# Altium schematic sheet Connector_Sheet.SchDoc
size A4; DocumentNumber: 5; SheetNumber: 6; SheetTotal: 6
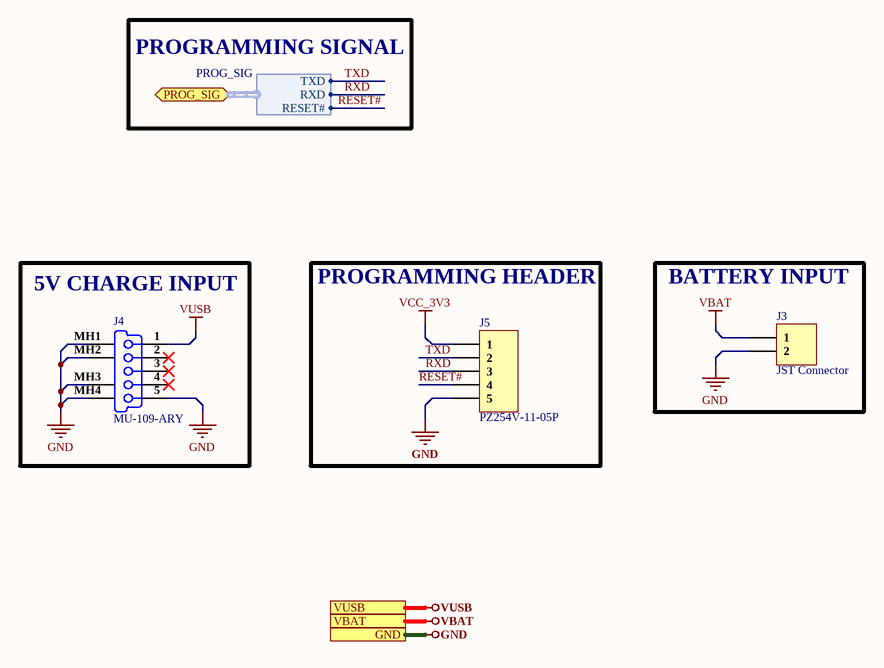
[diagram p0: Connector_Sheet.SchDoc]

## Parts
J3  JST Connector  [JST Connector]
J4  MU-109-ARY  [MU-109-ARY]
J5  PZ254V-11-05P  [PZ254V-11-05P]

## Blocks framed on the sheet
5V CHARGE INPUT: J4
PROGRAMMING HEADER: J5
BATTERY INPUT: J3

## Ports
GND, PROG_SIG (bidir, harness PROG_SIG), VBAT, VUSB

## Harnesses
PROG_SIG: TXD, RXD, RESET#

## Nets
GND: J3.2 J4.5(GND) J4.MH1(Tab) J4.MH2(Tab) J4.MH3(Tab) J4.MH4(Tab) J5.5 ; port GND
VBAT: J3.1 ; port VBAT
VCC_3V3: J5.1
VUSB: J4.1(V_BUS_(5V)) ; port VUSB
RESET#: J5.4 ; port PROG_SIG.RESET#
RXD: J5.3 ; port PROG_SIG.RXD
TXD: J5.2 ; port PROG_SIG.TXD

Not connected (* = marked no-connect by the designer): J4 2(D-)* 3(D+)* 4(ID)*

## Notes on the sheet
- PROGRAMMING SIGNAL
- 1
- Huzaifa Ali

## Library data of the parts
J3 = 2 Pin JST Connector
J4 = MU-109-ARY: 1.5A USB 2.0 1 Sink board 5 Female -20℃~+70℃ Micro-B SMD USB Connectors ROHS; Manufacturer: XUNPU; Manufacturer Part No: MU-109-ARY; Package: Custom; ComponentLink1Description: LCSC; ComponentLink1URL: https://lcsc.com/product-detail/span-style-background-color-ff0-USB-span-Connectors_XUNPU-MU-109-ARY_C720609.html
J5 = PZ254V-11-05P: Pin Header 5 1 right-angle; Manufacturer: XFCN; Brand Category: Made In Asia Brands; Pitch: 2.54; Packaging: Bag-packed; Connector Type: Pin Header; Number of Pins: 5; Number of Rows: 1